# Altium schematic sheet ISO_DC_DC.SchDoc
size A2; SheetNumber: 9; SheetTotal: 9
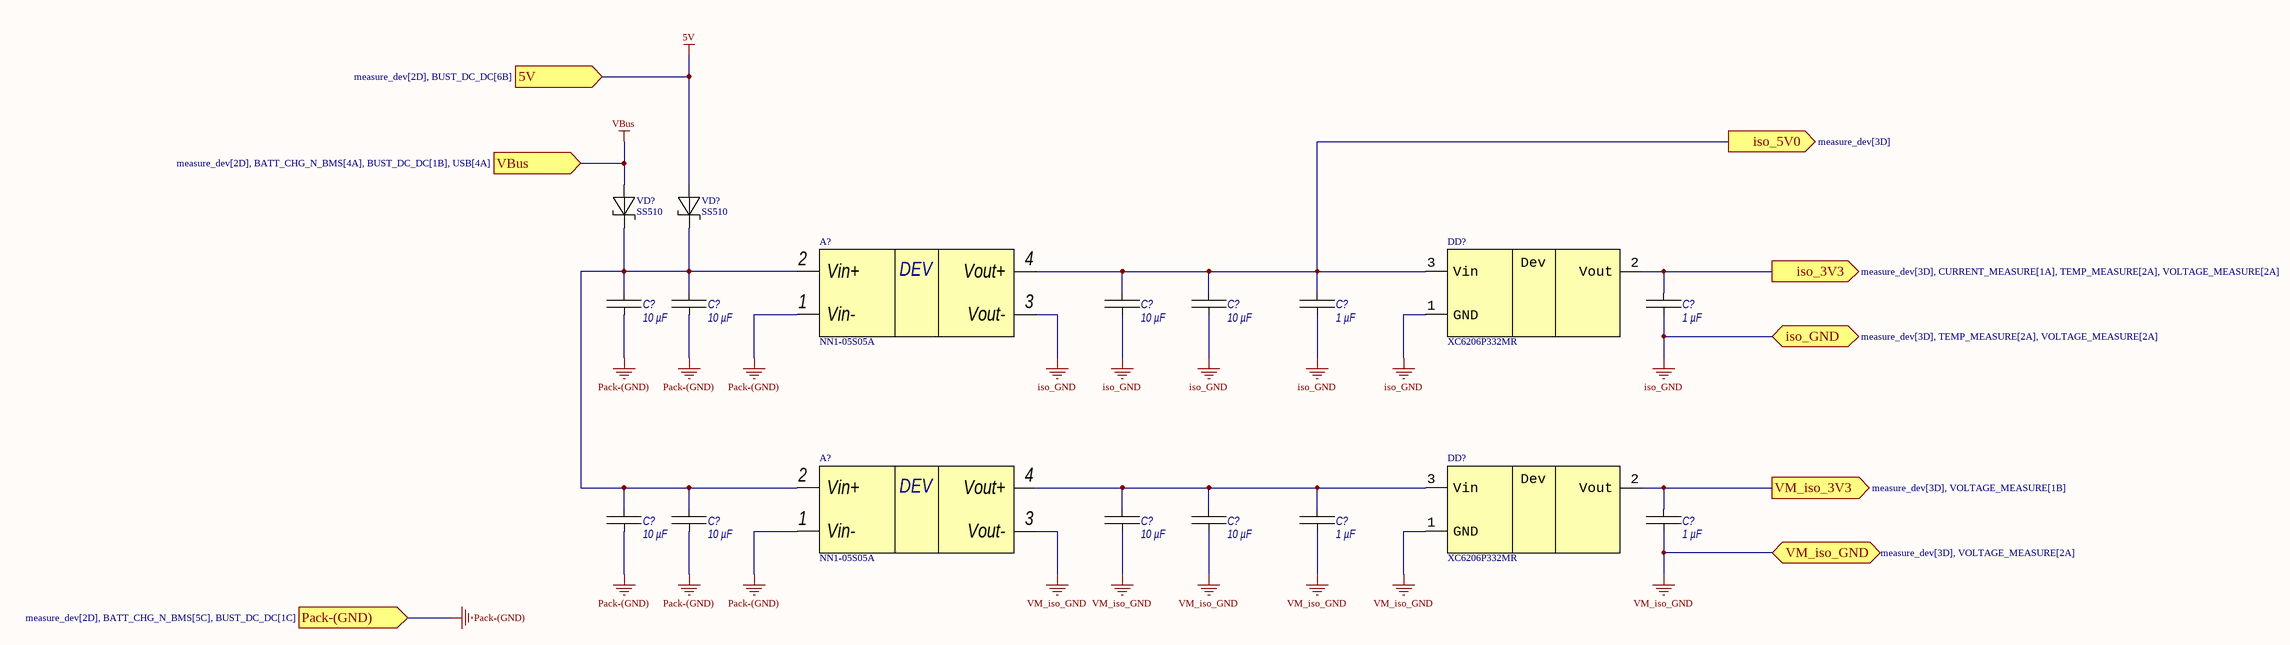
[diagram p0: ISO_DC_DC.SchDoc]

## Parts
(Parts that share a designator on the sheet are numbered #1, #2 ... from top to bottom, then left to right.)
A?#1  NN1-05S05A  [NN1-XXSXXA]
A?#2  NN1-05S05A  [NN1-XXSXXA]
C?#1  10 µF  [1206C]
C?#2  10 µF  [1206C]
C?#3  10 µF  [1206C]
C?#4  10 µF  [1206C]
C?#5  1 µF  [0603C]
C?#6  1 µF  [0603C]
C?#7  10 µF  [1206C]
C?#8  10 µF  [1206C]
C?#9  10 µF  [1206C]
C?#10  10 µF  [1206C]
C?#11  1 µF  [0603C]
C?#12  1 µF  [0603C]
DD?#1  XC6206P332MR  [SOT-23-3]
DD?#2  XC6206P332MR  [SOT-23-3]
VD?#1  SS510  [DO-214AC]
VD?#2  SS510  [DO-214AC]

## Ports
5V (in, see measure_dev[2D], BUST_DC_DC[6B]), iso_3V3 (out, see measure_dev[3D], CURRENT_MEASURE[1A], TEMP_MEASURE[2A], VOLTAGE_MEASURE[2A]), iso_5V0 (out, see measure_dev[3D]), iso_GND (bidir, see measure_dev[3D], TEMP_MEASURE[2A], VOLTAGE_MEASURE[2A]), Pack-(GND) (in, see measure_dev[2D], BATT_CHG_N_BMS[5C], BUST_DC_DC[1C]), VBus (in, see measure_dev[2D], BATT_CHG_N_BMS[4A], BUST_DC_DC[1B], USB[4A]), VM_iso_3V3 (out, see measure_dev[3D], VOLTAGE_MEASURE[1B]), VM_iso_GND (bidir, see measure_dev[3D], VOLTAGE_MEASURE[2A])

## Nets
5V: VD?#2.A ; port 5V
iso_GND: A?#1.3(Vout-) C?#3.2 C?#4.2 C?#5.2 C?#6.2 DD?#1.1(GND) ; port iso_GND
Pack-(GND): A?#1.1(Vin-) A?#2.1(Vin-) C?#1.2 C?#2.2 C?#7.2 C?#8.2 ; port Pack-(GND)
VBus: VD?#1.A ; port VBus
VM_iso_GND: A?#2.3(Vout-) C?#9.2 C?#10.2 C?#11.2 C?#12.2 DD?#2.1(GND) ; port VM_iso_GND
iso_3V3: C?#6.1 DD?#1.2(Vout) ; port iso_3V3
iso_5V0: A?#1.4(Vout+) C?#3.1 C?#4.1 C?#5.1 DD?#1.3(Vin) ; port iso_5V0
VM_iso_3V3: C?#12.1 DD?#2.2(Vout) ; port VM_iso_3V3
NetA?#1_2: A?#1.2(Vin+) A?#2.2(Vin+) C?#1.1 C?#2.1 C?#7.1 C?#8.1 VD?#1.C VD?#2.C
NetA?#2_4: A?#2.4(Vout+) C?#9.1 C?#10.1 C?#11.1 DD?#2.3(Vin)

## Notes on the sheet
- (in symbol NN1-05S05A) DEV
- (in symbol XC6206P332MR) Dev

## Library data of the parts
A?#1 A?#2 = NN1-05S05A: Manufacturer: DEXU Electronics; max Current: 200 mA; Vin min: 4.5 V; Vin max: 5.5 V; Vout min: 5 V; Part Number: NN1-05S05A; Package: NN1-XXSXXA; Vout max: 5 V; Vref: -; Type: isol DC/DC; Datasheet: https://static.chipdip.ru/lib/422/DOC033422675.pdf
C?#1-C?#4 C?#7-C?#10 = CL31B106KBHNNN: Manufacturer: Samsung; Tolerance: 10%; Voltage: 50 V; Dielectric: X7R; Part Number: CL31B106KBHNNN; Package: 1206; Value: 10 µF
C?#5 C?#6 C?#11 C?#12 = CL10B105KB8NNN: Manufacturer: Samsung; Tolerance: 10%; Voltage: 50 V; Dielectric: X7R; Part Number: CL10B105KB8NNN; Package: 0603; Value: 1 µF
DD?#1 DD?#2 = XC6206P332MR: Manufacturer: YOUTAI; max Current: 500 mA (300 mW); Vin max: 9 V; Vout min: 3.3 V; Part Number: XC6206P332MR; Package: SOT-23-3; Vin min: -; Vout max: 3.3 V; Vref: -; Type: LDO; Datasheet: https://static.chipdip.ru/lib/848/DOC018848972.pdf
VD?#1 VD?#2 = SS510: Manufacturer: UMW; max Current: 5 A; Reverse Voltage: 100 V; Part Number: SS510; Package: DO-214AC; Pppm: -; Datasheet: https://static.chipdip.ru/lib/293/DOC021293920.pdf